# EAGLE schematic orb (EAGLE 9.6.2)
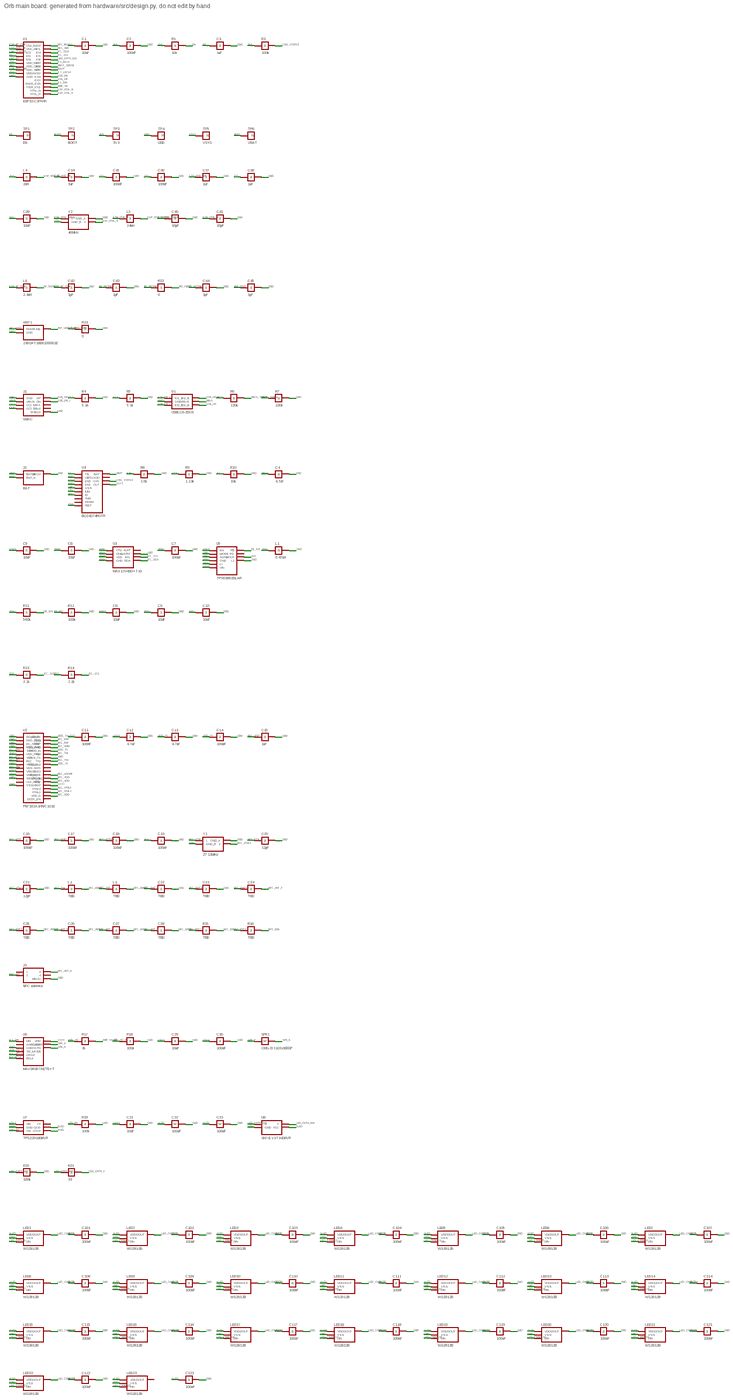
[diagram p0: schematic, sheet 1, overview]
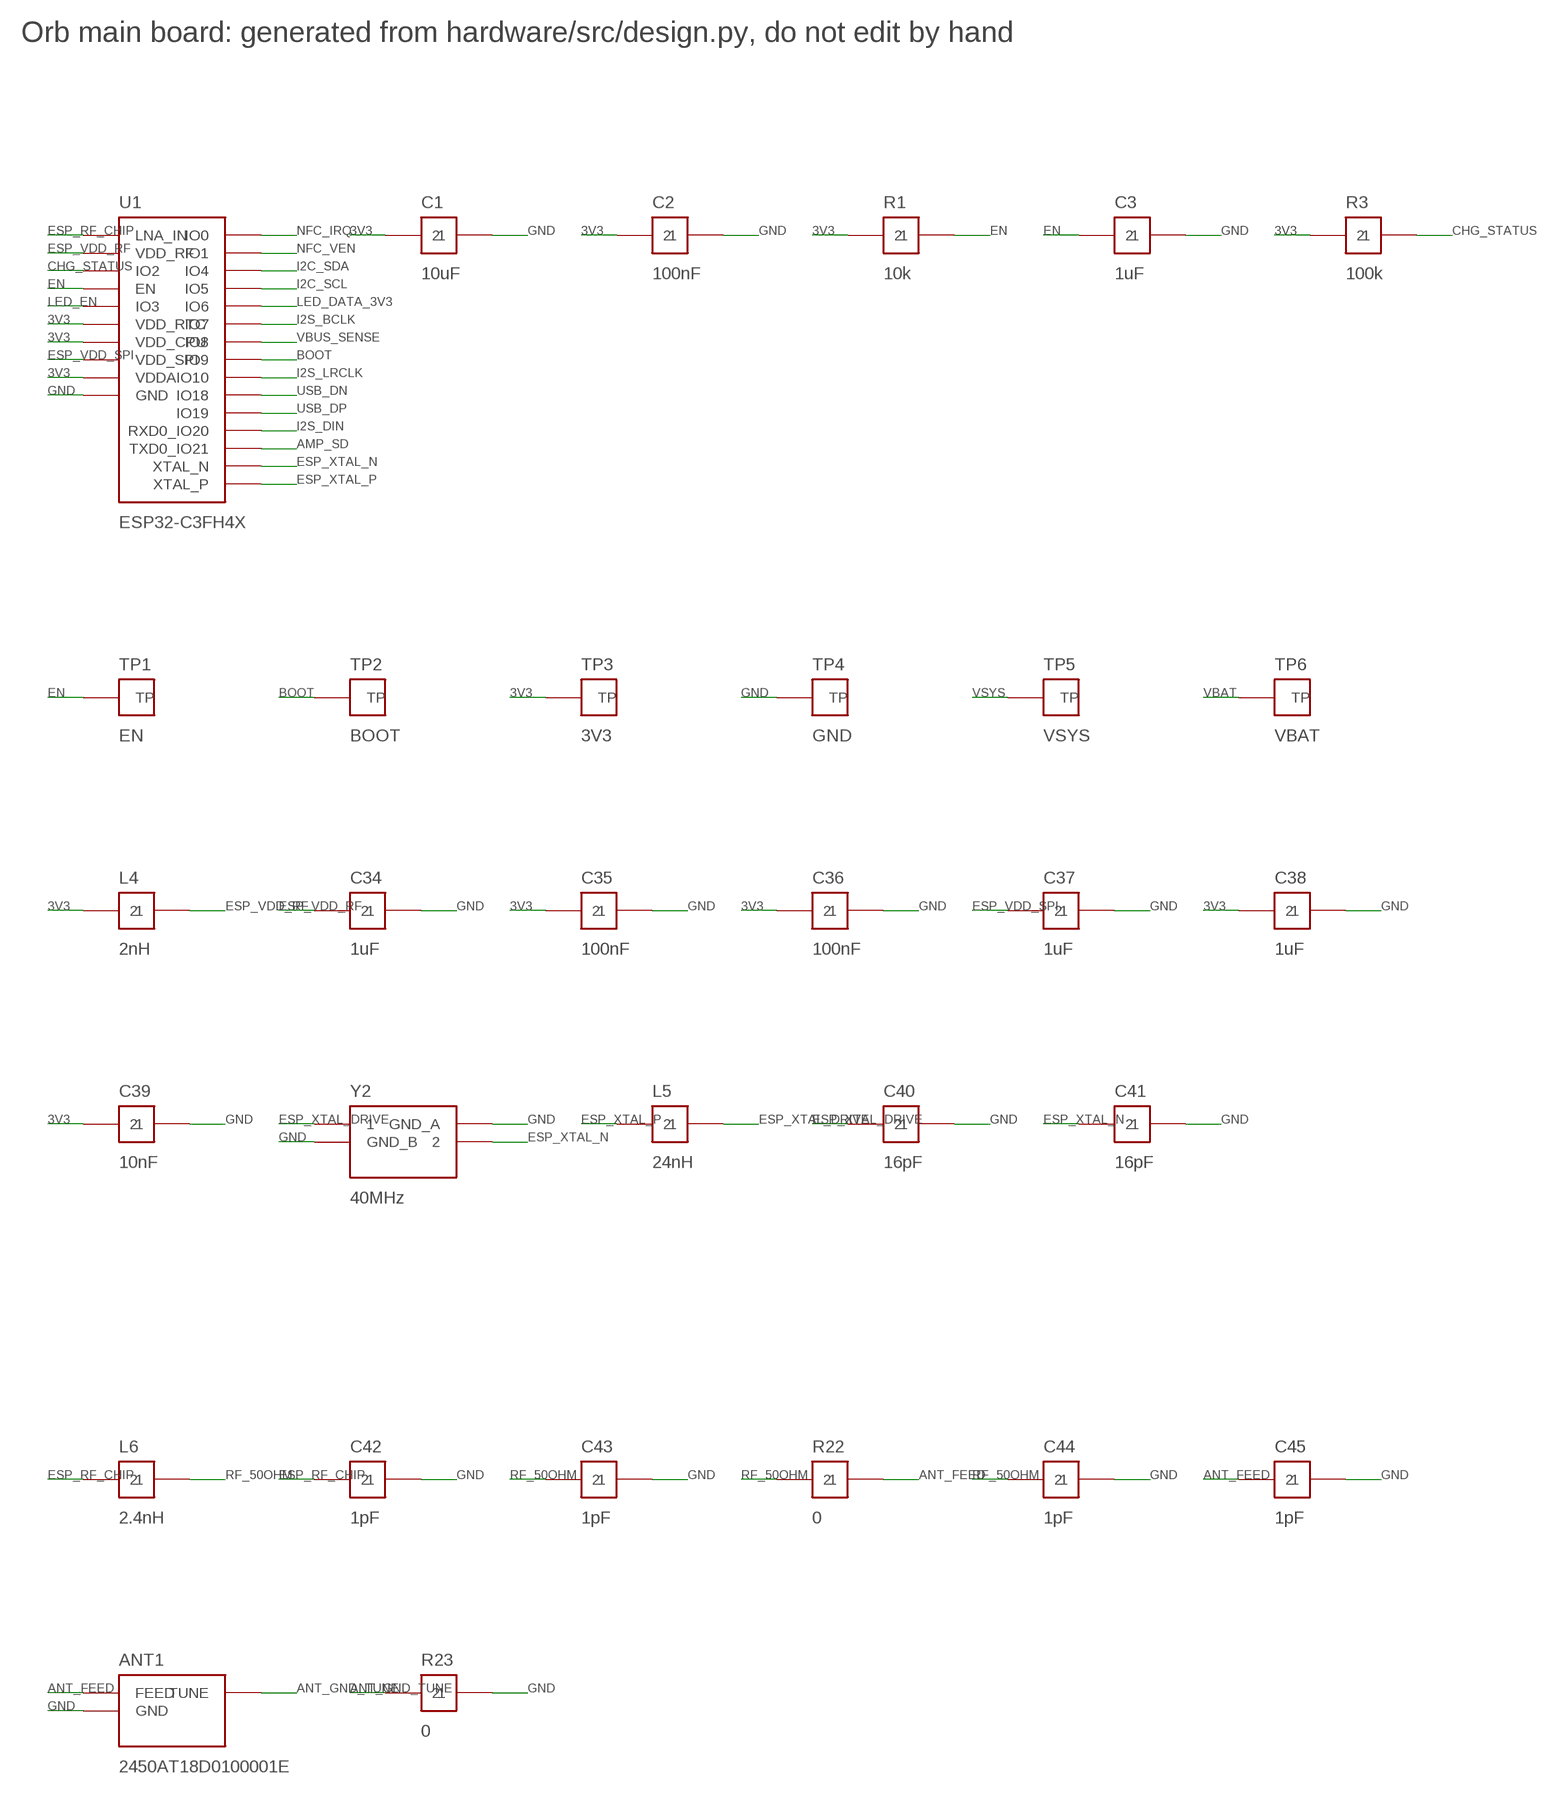
[diagram p1: schematic, sheet 1, part 1 of 5]
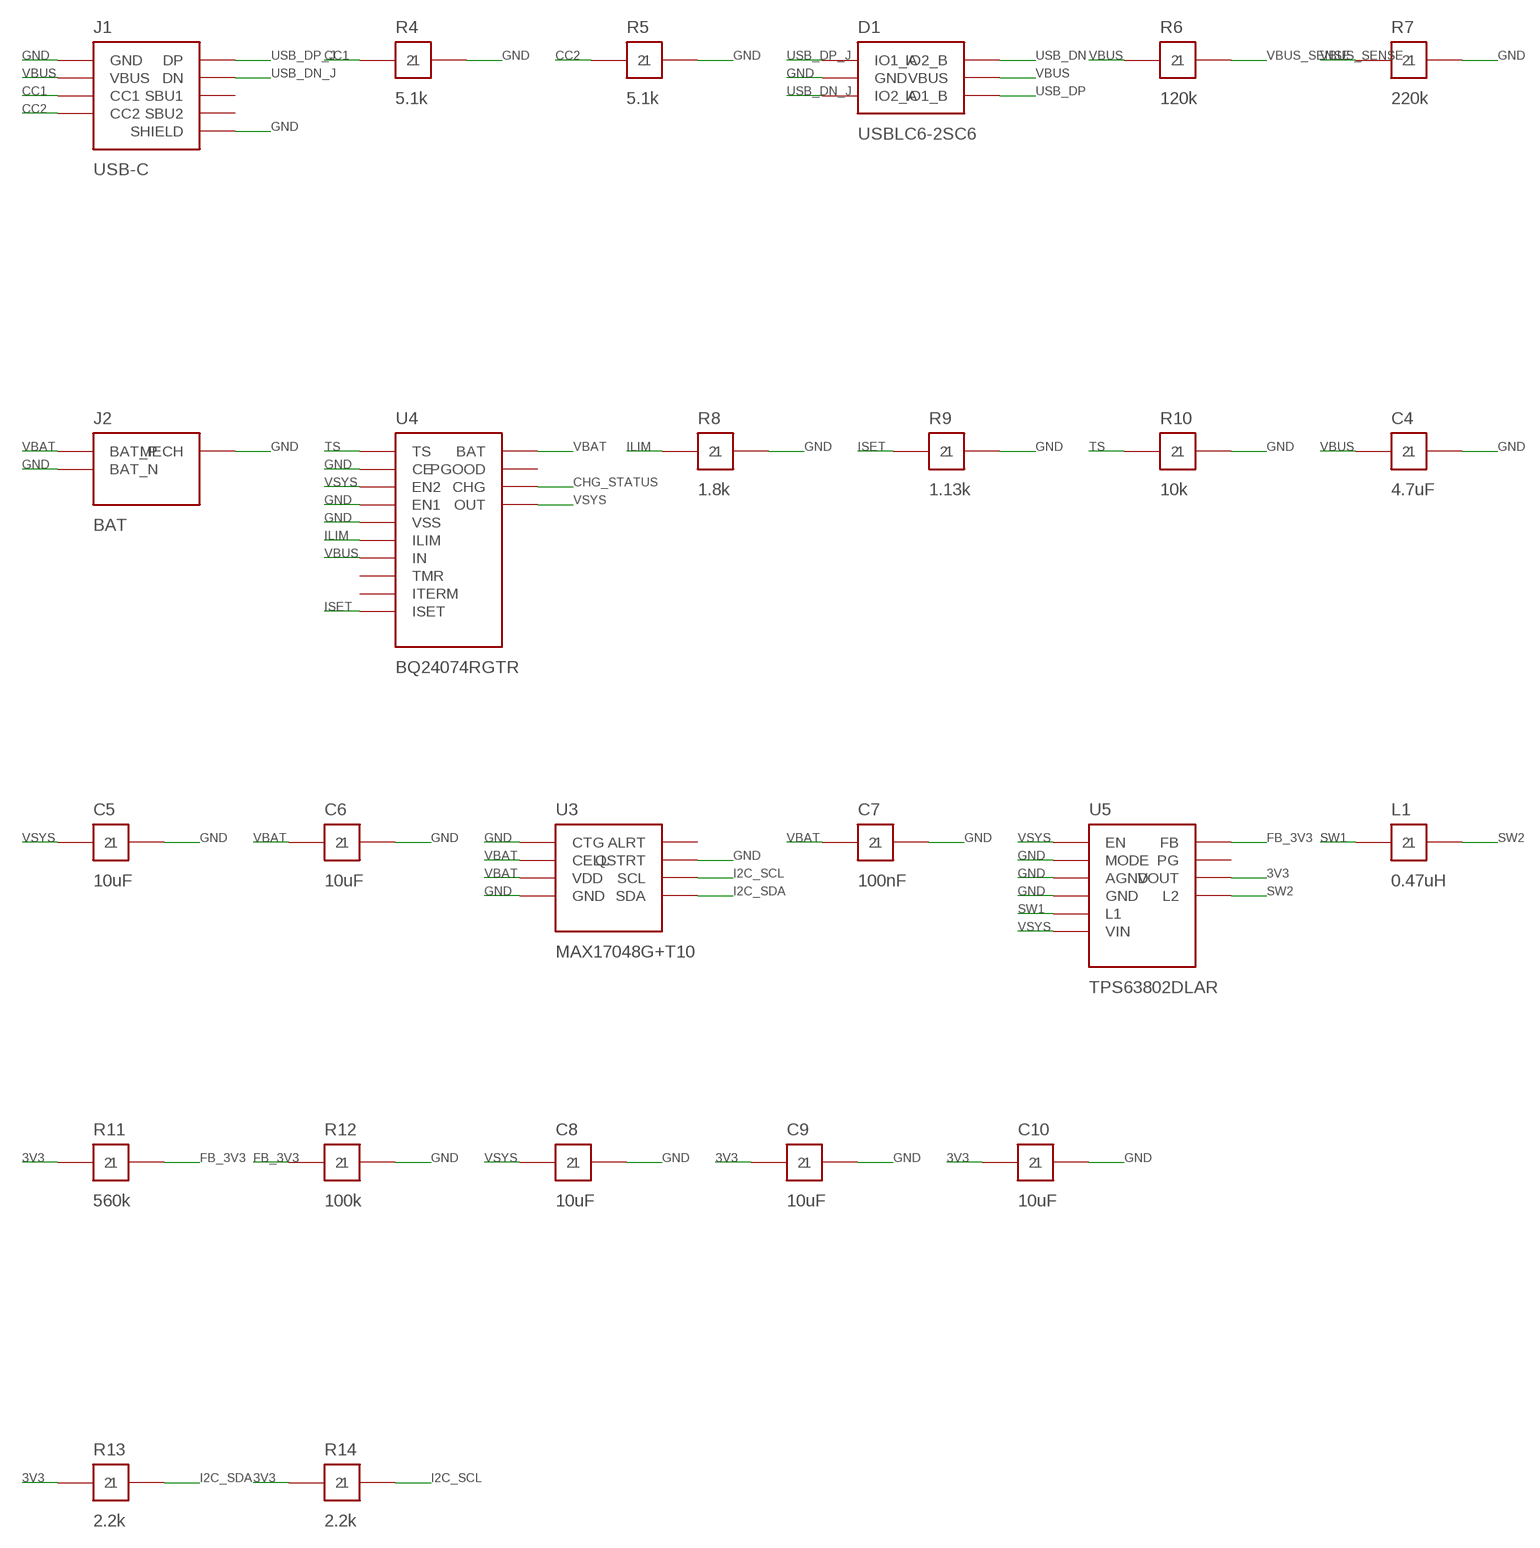
[diagram p2: schematic, sheet 1, part 2 of 5]
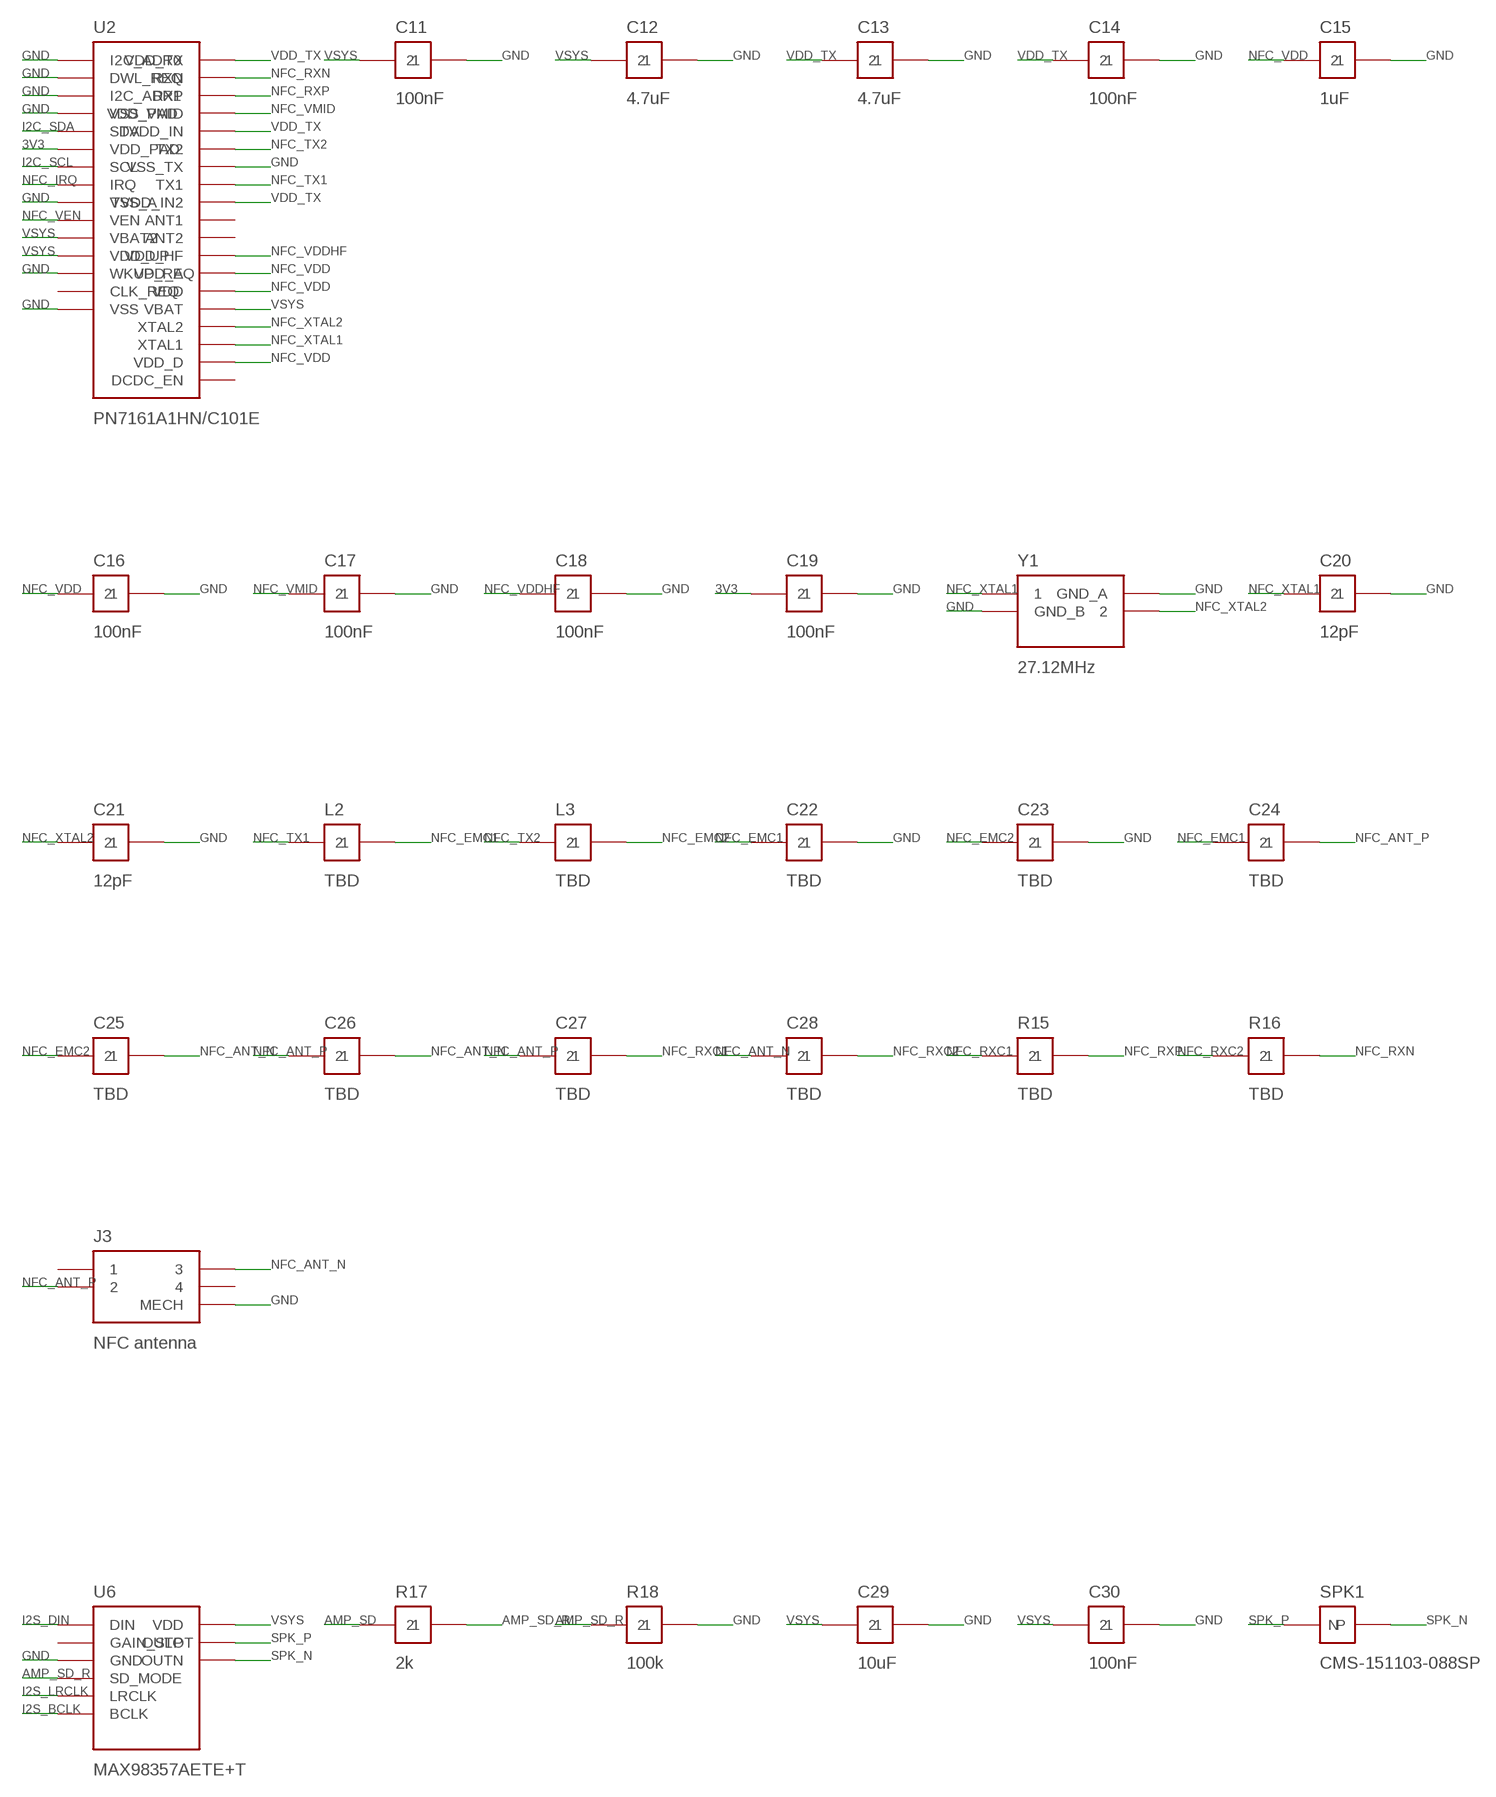
[diagram p3: schematic, sheet 1, part 3 of 5]
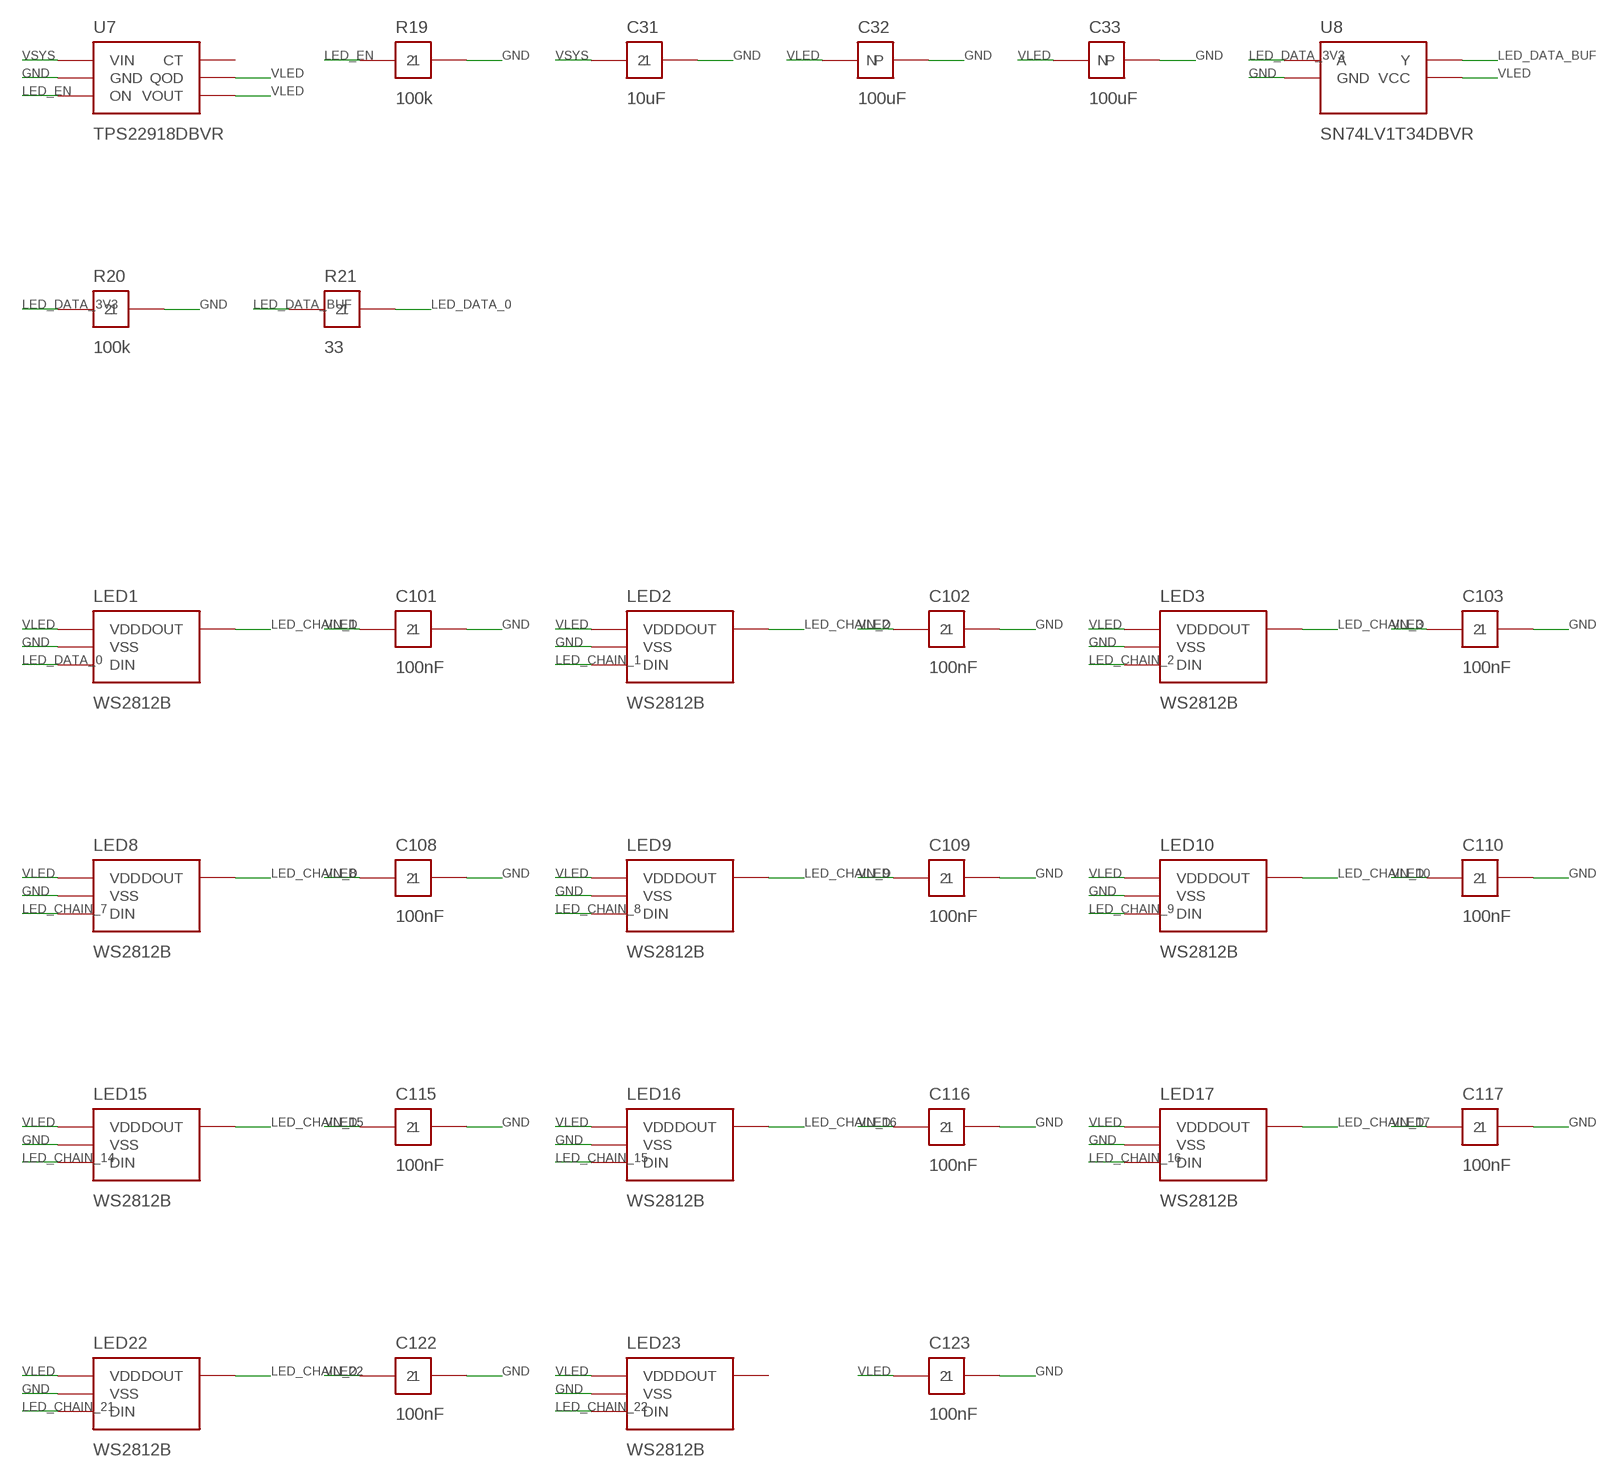
[diagram p4: schematic, sheet 1, part 4 of 5]
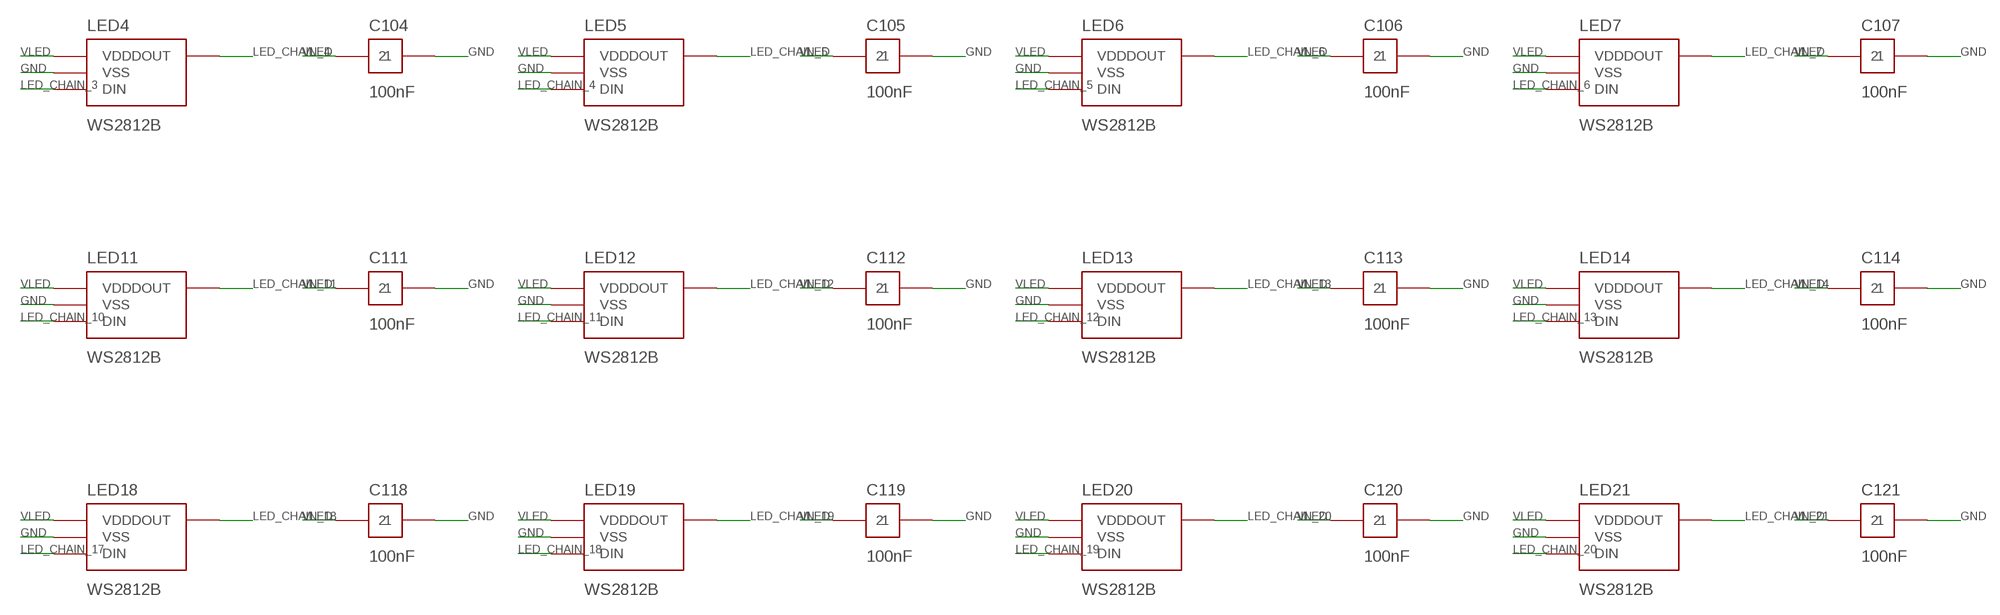
[diagram p5: schematic, sheet 1, part 5 of 5]

## Parts
ANT1  2450AT18D0100001E  ANT24  [JOHANSON_2450AT18D]
C1  10uF  C0603  [C0603]
C2  100nF  C  [C0402]
C3  1uF  C  [C0402]
C4  4.7uF  C0603  [C0603]
C5  10uF  C0603  [C0603]
C6  10uF  C0603  [C0603]
C7  100nF  C  [C0402]
C8  10uF  C0603  [C0603]
C9  10uF  C0603  [C0603]
C10  10uF  C0603  [C0603]
C11  100nF  C  [C0402]
C12  4.7uF  C0603  [C0603]
C13  4.7uF  C0603  [C0603]
C14  100nF  C  [C0402]
C15  1uF  C  [C0402]
C16  100nF  C  [C0402]
C17  100nF  C  [C0402]
C18  100nF  C  [C0402]
C19  100nF  C  [C0402]
C20  12pF  C  [C0402]
C21  12pF  C  [C0402]
C22  TBD  C  [C0402]
C23  TBD  C  [C0402]
C24  TBD  C  [C0402]
C25  TBD  C  [C0402]
C26  TBD  C  [C0402]
C27  TBD  C  [C0402]
C28  TBD  C  [C0402]
C29  10uF  C0603  [C0603]
C30  100nF  C  [C0402]
C31  10uF  C0603  [C0603]
C32  100uF  CPOL  [CPOL7343]
C33  100uF  CPOL  [CPOL7343]
C34  1uF  C  [C0402]
C35  100nF  C  [C0402]
C36  100nF  C  [C0402]
C37  1uF  C  [C0402]
C38  1uF  C  [C0402]
C39  10nF  C  [C0402]
C40  16pF  C  [C0402]
C41  16pF  C  [C0402]
C42  1pF  C  [C0402]
C43  1pF  C  [C0402]
C44  1pF  C  [C0402]
C45  1pF  C  [C0402]
C101  100nF  C  [C0402]
C102  100nF  C  [C0402]
C103  100nF  C  [C0402]
C104  100nF  C  [C0402]
C105  100nF  C  [C0402]
C106  100nF  C  [C0402]
C107  100nF  C  [C0402]
C108  100nF  C  [C0402]
C109  100nF  C  [C0402]
C110  100nF  C  [C0402]
C111  100nF  C  [C0402]
C112  100nF  C  [C0402]
C113  100nF  C  [C0402]
C114  100nF  C  [C0402]
C115  100nF  C  [C0402]
C116  100nF  C  [C0402]
C117  100nF  C  [C0402]
C118  100nF  C  [C0402]
C119  100nF  C  [C0402]
C120  100nF  C  [C0402]
C121  100nF  C  [C0402]
C122  100nF  C  [C0402]
C123  100nF  C  [C0402]
D1  USBLC6-2SC6  USBLC6  [SOT23_6]
J1  USB-C  USBC  [USBC24_TE2345986]
J2  BAT  JST_BAT  [JST_S2B_PH_SM4_TB]
J3  NFC antenna  FPC4  [FPC4_PLACEHOLDER]
L1  0.47uH  L_PWR  [L2016]
L2  TBD  L  [L0402]
L3  TBD  L  [L0402]
L4  2nH  L  [L0402]
L5  24nH  L  [L0402]
L6  2.4nH  L  [L0402]
LED1  WS2812B  [WS2812B_5050]
LED2  WS2812B  [WS2812B_5050]
LED3  WS2812B  [WS2812B_5050]
LED4  WS2812B  [WS2812B_5050]
LED5  WS2812B  [WS2812B_5050]
LED6  WS2812B  [WS2812B_5050]
LED7  WS2812B  [WS2812B_5050]
LED8  WS2812B  [WS2812B_5050]
LED9  WS2812B  [WS2812B_5050]
LED10  WS2812B  [WS2812B_5050]
LED11  WS2812B  [WS2812B_5050]
LED12  WS2812B  [WS2812B_5050]
LED13  WS2812B  [WS2812B_5050]
LED14  WS2812B  [WS2812B_5050]
LED15  WS2812B  [WS2812B_5050]
LED16  WS2812B  [WS2812B_5050]
LED17  WS2812B  [WS2812B_5050]
LED18  WS2812B  [WS2812B_5050]
LED19  WS2812B  [WS2812B_5050]
LED20  WS2812B  [WS2812B_5050]
LED21  WS2812B  [WS2812B_5050]
LED22  WS2812B  [WS2812B_5050]
LED23  WS2812B  [WS2812B_5050]
R1  10k  R  [R0402]
R3  100k  R  [R0402]
R4  5.1k  R  [R0402]
R5  5.1k  R  [R0402]
R6  120k  R  [R0402]
R7  220k  R  [R0402]
R8  1.8k  R  [R0402]
R9  1.13k  R  [R0402]
R10  10k  R  [R0402]
R11  560k  R  [R0402]
R12  100k  R  [R0402]
R13  2.2k  R  [R0402]
R14  2.2k  R  [R0402]
R15  TBD  R  [R0402]
R16  TBD  R  [R0402]
R17  2k  R  [R0402]
R18  100k  R  [R0402]
R19  100k  R  [R0402]
R20  100k  R  [R0402]
R21  33  R  [R0402]
R22  0  R  [R0402]
R23  0  R  [R0402]
SPK1  CMS-151103-088SP  SPK  [SPK_PADS]
TP1  EN  TP  [TP1MM]
TP2  BOOT  TP  [TP1MM]
TP3  3V3  TP  [TP1MM]
TP4  GND  TP  [TP1MM]
TP5  VSYS  TP  [TP1MM]
TP6  VBAT  TP  [TP1MM]
U1  ESP32-C3FH4X  ESP32C3FH4X  [ESP32C3_QFN32]
U2  PN7161A1HN/C101E  PN7161  [HVQFN40_6X6]
U3  MAX17048G+T10  MAX17048  [TDFN8_2X2]
U4  BQ24074RGTR  BQ24074  [VQFN16_3X3]
U5  TPS63802DLAR  TPS63802  [VSON10_2X3]
U6  MAX98357AETE+T  MAX98357A  [TQFN16_3X3]
U7  TPS22918DBVR  TPS22918  [SOT23_6]
U8  SN74LV1T34DBVR  SN74LV1T34  [SOT23_5]
Y1  27.12MHz  XTAL  [XTAL2016]
Y2  40MHz  XTAL40  [ABM8_3225]

## Nets
3V3 [3V3]: C1.1 C2.1 C9.1 C10.1 C19.1 C35.1 C36.1 C38.1 C39.1 L4.1 R1.1 R3.1 R11.1 R13.1 R14.1 TP3.1(TP) U1.11(VDD_RTC) U1.17(VDD_CPU) U1.31(VDDA) U1.32(VDDA) U2.6(VDD_PAD) U5.6(VOUT)
AMP_SD: R17.1 U1.28(TXD0_IO21)
AMP_SD_R: R17.2 R18.1 U6.4(SD_MODE)
ANT_FEED [RF]: ANT1.1(FEED) C45.1 R22.2
ANT_GND_TUNE [RF]: ANT1.3(TUNE) R23.1
BOOT: TP2.1(TP) U1.15(IO9)
CC1: J1.A5(CC1) R4.1
CC2: J1.B5(CC2) R5.1
CHG_STATUS: R3.2 U1.6(IO2) U4.9(CHG)
EN: C3.1 R1.2 TP1.1(TP) U1.7(EN)
ESP_RF_CHIP [RF]: C42.1 L6.1 U1.1(LNA_IN)
ESP_VDD_RF [3V3]: C34.1 L4.2 U1.2(VDD_RF) U1.3(VDD_RF)
ESP_VDD_SPI: C37.1 U1.18(VDD_SPI)
ESP_XTAL_DRIVE: C40.1 L5.2 Y2.1
ESP_XTAL_N: C41.1 U1.29(XTAL_N) Y2.3
ESP_XTAL_P: L5.1 U1.30(XTAL_P)
FB_3V3: R11.2 R12.1 U5.4(FB)
GND: ANT1.2(GND) ANT1.4(GND) C1.2 C2.2 C3.2 C4.2 C5.2 C6.2 C7.2 C8.2 C9.2 C10.2 C11.2 C12.2 C13.2 C14.2 C15.2 C16.2 C17.2 C18.2 C19.2 C20.2 C21.2 C22.2 C23.2 C29.2 C30.2 C31.2 C32.2(N) C33.2(N) C34.2 C35.2 C36.2 C37.2 C38.2 C39.2 C40.2 C41.2 C42.2 C43.2 C44.2 C45.2 C101.2 C102.2 C103.2 C104.2 C105.2 C106.2 C107.2 C108.2 C109.2 C110.2 C111.2 C112.2 C113.2 C114.2 C115.2 C116.2 C117.2 C118.2 C119.2 C120.2 C121.2 C122.2 C123.2 D1.2(GND) J1.A1(GND) J1.A12(GND) J1.B1(GND) J1.B12(GND) J1.S1(SHIELD) J1.S2(SHIELD) J1.S3(SHIELD) J1.S4(SHIELD) J2.2(BAT_N) J2.S1(MECH) J2.S2(MECH) J3.M1(MECH) J3.M2(MECH) LED1.3(VSS) LED2.3(VSS) LED3.3(VSS) LED4.3(VSS) LED5.3(VSS) LED6.3(VSS) LED7.3(VSS) LED8.3(VSS) LED9.3(VSS) LED10.3(VSS) LED11.3(VSS) LED12.3(VSS) LED13.3(VSS) LED14.3(VSS) LED15.3(VSS) LED16.3(VSS) LED17.3(VSS) LED18.3(VSS) LED19.3(VSS) LED20.3(VSS) LED21.3(VSS) LED22.3(VSS) LED23.3(VSS) R4.2 R5.2 R7.2 R8.2 R9.2 R10.2 R12.2 R18.2 R19.2 R20.2 R23.2 TP4.1(TP) U1.33(GND) U2.1(I2C_ADR0) U2.2(DWL_REQ) U2.3(I2C_ADR1) U2.4(VSS_PAD) U2.9(VSS_A) U2.20(VSS_TX) U2.39(WKUP_REQ) U2.41(VSS) U3.1(CTG) U3.4(GND) U3.6(QSTRT) U3.9(GND) U4.4(CE) U4.6(EN1) U4.8(VSS) U4.17(VSS) U5.2(MODE) U5.3(AGND) U5.8(GND) U6.3(GND) U6.11(GND) U6.15(GND) U6.17(GND) U7.2(GND) U8.3(GND) Y1.2(GND_A) Y1.4(GND_B) Y2.2(GND_A) Y2.4(GND_B)
I2C_SCL: R14.2 U1.10(IO5) U2.7(SCL) U3.7(SCL)
I2C_SDA: R13.2 U1.9(IO4) U2.5(SDA) U3.8(SDA)
I2S_BCLK: U1.13(IO7) U6.16(BCLK)
I2S_DIN: U1.27(RXD0_IO20) U6.1(DIN)
I2S_LRCLK: U1.16(IO10) U6.14(LRCLK)
ILIM: R8.1 U4.12(ILIM)
ISET: R9.1 U4.16(ISET)
LED_CHAIN_1: LED1.2(DOUT) LED2.4(DIN)
LED_CHAIN_2: LED2.2(DOUT) LED3.4(DIN)
LED_CHAIN_3: LED3.2(DOUT) LED4.4(DIN)
LED_CHAIN_4: LED4.2(DOUT) LED5.4(DIN)
LED_CHAIN_5: LED5.2(DOUT) LED6.4(DIN)
LED_CHAIN_6: LED6.2(DOUT) LED7.4(DIN)
LED_CHAIN_7: LED7.2(DOUT) LED8.4(DIN)
LED_CHAIN_8: LED8.2(DOUT) LED9.4(DIN)
LED_CHAIN_9: LED9.2(DOUT) LED10.4(DIN)
LED_CHAIN_10: LED10.2(DOUT) LED11.4(DIN)
LED_CHAIN_11: LED11.2(DOUT) LED12.4(DIN)
LED_CHAIN_12: LED12.2(DOUT) LED13.4(DIN)
LED_CHAIN_13: LED13.2(DOUT) LED14.4(DIN)
LED_CHAIN_14: LED14.2(DOUT) LED15.4(DIN)
LED_CHAIN_15: LED15.2(DOUT) LED16.4(DIN)
LED_CHAIN_16: LED16.2(DOUT) LED17.4(DIN)
LED_CHAIN_17: LED17.2(DOUT) LED18.4(DIN)
LED_CHAIN_18: LED18.2(DOUT) LED19.4(DIN)
LED_CHAIN_19: LED19.2(DOUT) LED20.4(DIN)
LED_CHAIN_20: LED20.2(DOUT) LED21.4(DIN)
LED_CHAIN_21: LED21.2(DOUT) LED22.4(DIN)
LED_CHAIN_22: LED22.2(DOUT) LED23.4(DIN)
LED_DATA_0: LED1.4(DIN) R21.2
LED_DATA_3V3: R20.1 U1.12(IO6) U8.2(A)
LED_DATA_BUF: R21.1 U8.4(Y)
LED_EN: R19.1 U1.8(IO3) U7.3(ON)
NFC_ANT_N: C25.2 C26.2 C28.1 J3.3
NFC_ANT_P: C24.2 C26.1 C27.1 J3.2
NFC_EMC1: C22.1 C24.1 L2.2
NFC_EMC2: C23.1 C25.1 L3.2
NFC_IRQ: U1.4(IO0) U2.8(IRQ)
NFC_RXC1: C27.2 R15.1
NFC_RXC2: C28.2 R16.1
NFC_RXN: R16.2 U2.15(RXN)
NFC_RXP: R15.2 U2.16(RXP)
NFC_TX1: L2.1 U2.21(TX1)
NFC_TX2: L3.1 U2.19(TX2)
NFC_VDD: C15.1 C16.1 U2.26(VDD_A) U2.27(VDD) U2.31(VDD_D)
NFC_VDDHF: C18.1 U2.25(VDD_HF)
NFC_VEN: U1.5(IO1) U2.10(VEN)
NFC_VMID: C17.1 U2.17(VDD_VMID)
NFC_XTAL1: C20.1 U2.30(XTAL1) Y1.1
NFC_XTAL2: C21.1 U2.29(XTAL2) Y1.3
RF_50OHM [RF]: C43.1 C44.1 L6.2 R22.1
SPK_N: SPK1.2(N) U6.10(OUTN)
SPK_P: SPK1.1(P) U6.9(OUTP)
SW1: L1.1 U5.9(L1)
SW2: L1.2 U5.7(L2)
TS: R10.1 U4.1(TS)
USB_DN [USB]: D1.4(IO2_B) U1.25(IO18)
USB_DN_J [USB]: D1.3(IO2_A) J1.A7(DN) J1.B7(DN)
USB_DP [USB]: D1.6(IO1_B) U1.26(IO19)
USB_DP_J [USB]: D1.1(IO1_A) J1.A6(DP) J1.B6(DP)
VBAT [power]: C6.1 C7.1 J2.1(BAT_P) TP6.1(TP) U3.2(CELL) U3.3(VDD) U4.2(BAT) U4.3(BAT)
VBUS [power]: C4.1 D1.5(VBUS) J1.A4(VBUS) J1.A9(VBUS) J1.B4(VBUS) J1.B9(VBUS) R6.1 U4.13(IN)
VBUS_SENSE: R6.2 R7.1 U1.14(IO8)
VDD_TX: C13.1 C14.1 U2.14(VDD_TX) U2.18(TVDD_IN) U2.22(TVDD_IN2)
VLED [LED-power]: C32.1(P) C33.1(P) C101.1 C102.1 C103.1 C104.1 C105.1 C106.1 C107.1 C108.1 C109.1 C110.1 C111.1 C112.1 C113.1 C114.1 C115.1 C116.1 C117.1 C118.1 C119.1 C120.1 C121.1 C122.1 C123.1 LED1.1(VDD) LED2.1(VDD) LED3.1(VDD) LED4.1(VDD) LED5.1(VDD) LED6.1(VDD) LED7.1(VDD) LED8.1(VDD) LED9.1(VDD) LED10.1(VDD) LED11.1(VDD) LED12.1(VDD) LED13.1(VDD) LED14.1(VDD) LED15.1(VDD) LED16.1(VDD) LED17.1(VDD) LED18.1(VDD) LED19.1(VDD) LED20.1(VDD) LED21.1(VDD) LED22.1(VDD) LED23.1(VDD) U7.5(QOD) U7.6(VOUT) U8.5(VCC)
VSYS [power]: C5.1 C8.1 C11.1 C12.1 C29.1 C30.1 C31.1 TP5.1(TP) U2.12(VBAT2) U2.13(VDD_UP) U2.28(VBAT) U4.5(EN2) U4.10(OUT) U4.11(OUT) U5.1(EN) U5.10(VIN) U6.7(VDD) U6.8(VDD) U7.1(VIN)
Unconnected: J1.A8(SBU1) J1.B8(SBU2) J3.1 J3.4 LED23.2(DOUT) U2.23(ANT1) U2.24(ANT2) U2.37(DCDC_EN) U2.40(CLK_REQ) U3.5(ALRT) U4.7(PGOOD) U4.14(TMR) U4.15(ITERM) U5.5(PG) U6.2(GAIN_SLOT) U7.4(CT)

## Notes on the sheet
- Orb main board: generated from hardware/src/design.py, do not edit by hand

## Library data of the parts
ANT1 = orb:ANT24: Johanson 2450AT18D0100001E 2.4 GHz SMT antenna, thin-edge reference layout
C1 C4-C6 C8-C10 C12 C13 C29 C31 = orb:C0603: Capacitor
C2 C3 C7 C11 C14-C28 C30 C34-C45 C101-C123 = orb:C: Capacitor
C32 C33 = orb:CPOL: Polymer capacitor
D1 = orb:USBLC6: ST USBLC6-2SC6 USB ESD protection (SOT-23-6)
J1 = orb:USBC: TE Connectivity 2345986-1 USB-C receptacle (24 pads, USB 3.1 top mount, dual row SMT; only the USB 2.0 pads are used)
J2 = orb:JST_BAT: JST S2B-PH-SM4-TB battery header
J3 = orb:FPC4: Hirose FH19C-4S-0.5SH(10), 0.5 mm pitch, 0.2 mm bottom-contact FPC
L1 = orb:L_PWR: Power inductor
L2-L6 = orb:L: Inductor
LED1-LED23 = orb:WS2812B: WS2812B addressable LED (5050; revision TBC)
R1 R3-R23 = orb:R: Resistor
SPK1 = orb:SPK: Speaker CMS-151103-088SP (wire or pad connection)
TP1-TP6 = orb:TP: Test pad
U1 = orb:ESP32C3FH4X: Espressif ESP32-C3FH4X, 4 MB in-package flash, QFN32 5 x 5 mm
U2 = orb:PN7161: NXP PN7161A1HN NFC controller (I2C)
U3 = orb:MAX17048: Analog/Maxim MAX17048G+T10 fuel gauge (TDFN-8)
U4 = orb:BQ24074: TI BQ24074RGTR charger and power path (VQFN-16)
U5 = orb:TPS63802: TI TPS63802DLAR buck-boost 3.3 V (VSON-10)
U6 = orb:MAX98357A: Analog/Maxim MAX98357AETE+T I2S Class D amplifier (TQFN-16)
U7 = orb:TPS22918: TI TPS22918DBVR load switch (SOT-23-6)
U8 = orb:SN74LV1T34: TI SN74LV1T34DBVR level-shifting buffer (SOT-23-5)
Y1 = orb:XTAL: Crystal
Y2 = orb:XTAL40: Abracon ABM8 3.2 x 2.5 mm 40 MHz crystal

## Net classes
0 signal: width 0.15 mm, drill 0.2 mm
1 power: width 0.15 mm, drill 0.2 mm
2 LED-power: width 0.15 mm, drill 0.2 mm
3 3V3: width 0.15 mm, drill 0.2 mm
4 RF: width 0.15 mm, drill 0.2 mm
5 USB: width 0.15 mm, drill 0.2 mm